# Altium schematic sheet Button.SchDoc
size A4; SheetNumber: 8; SheetTotal: 8
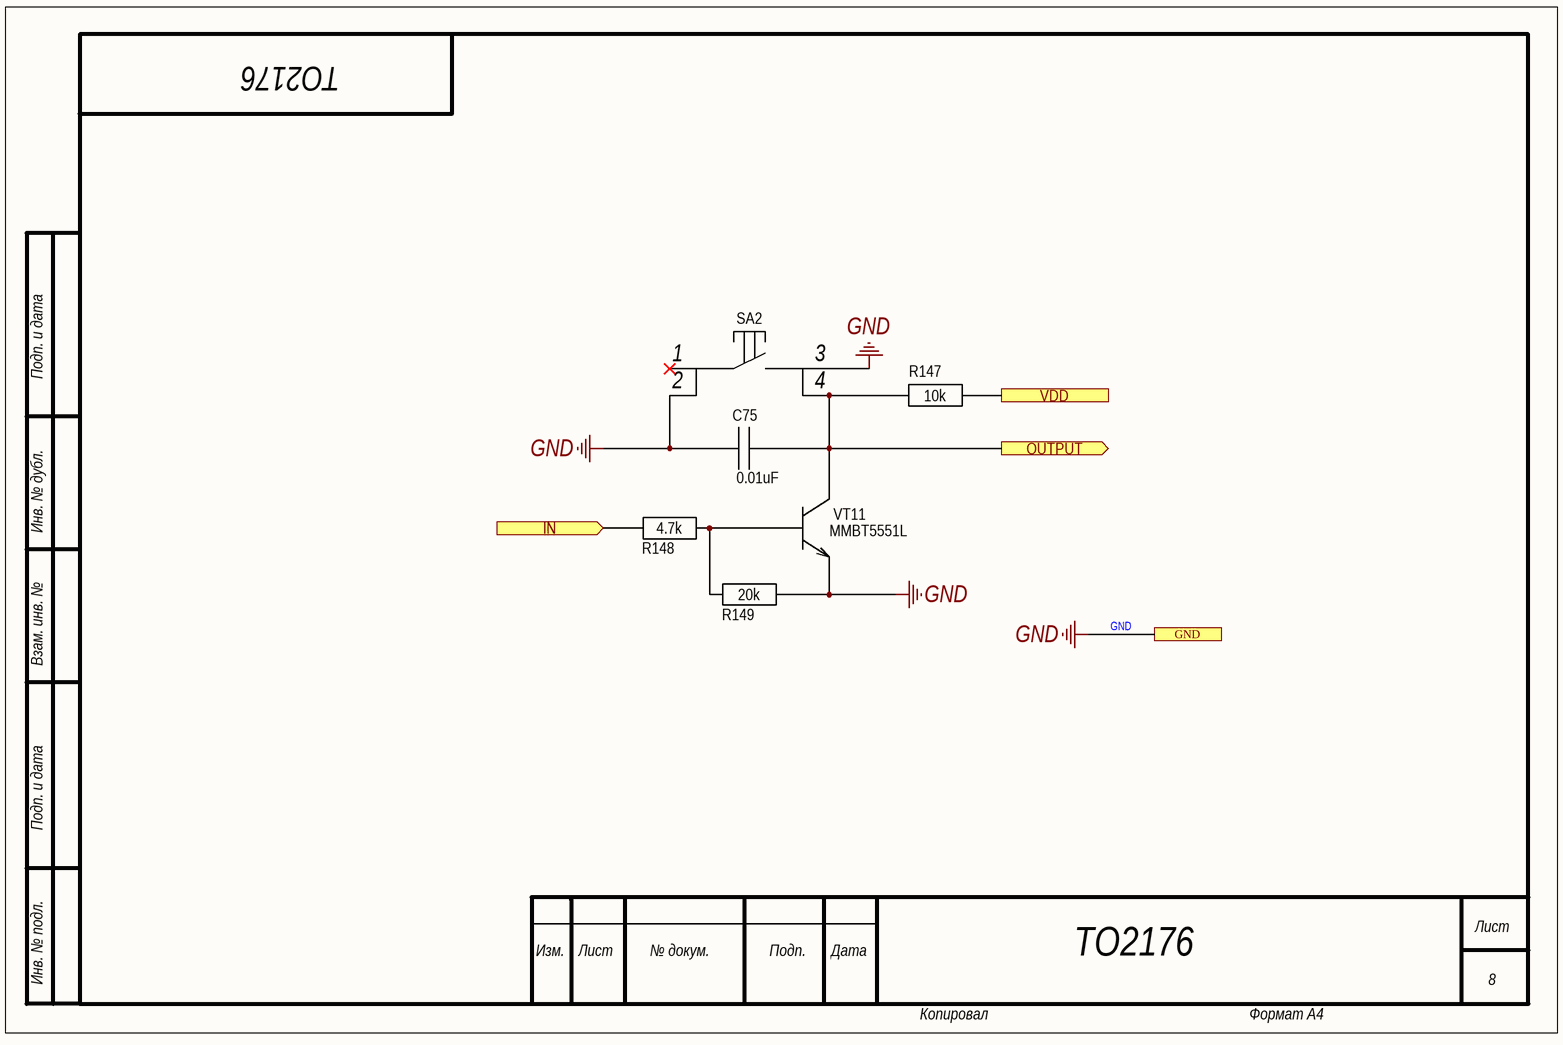
[diagram p0: Button.SchDoc]

## Parts
C75  0.01uF  [0805]
R147  10k  [0805]
R148  4.7k  [0805]
R149  20k  [0805]
SA2  KLS7-TS3401  [KLS7-TS3401]  (value not drawn)
VT11  MMBT5551L  [SOT-23]

## Ports
GND, IN (in), OUTPUT (out), VDD

## Nets
GND: C75.1 R149.1 SA2.2 SA2.3 VT11.2(E) ; port GND
IN: R148.2 ; port IN
OUTPUT: C75.2 R147.2 SA2.4 VT11.3(K) ; port OUTPUT
VDD: R147.1 ; port VDD
NetR148_1: R148.1 R149.2 VT11.1(B)

Not connected (* = marked no-connect by the designer): SA2 1*

## Notes on the sheet
- ТО2176
- Подп. и дата
- Инв. № дубл.
- Взам. инв. №
- Инв. № подл.
- Изм.
- Лист
- № докум.
- Подп.
- Дата
- 8
- Копировал
- Формат А4
- Перв. примен.
- Справ. №
- Разраб.
- Литера
- Масса
- Масштаб
- Пров.
- Т.контр.
- Листов
- Н.контр.
- Утв.
- Форма 1 ГОСТ 2.104-2006

## Library data of the parts
C75 = C0805: ComponentHeigt: 1.3; Firme: AVX; Leadform: SMD; KIND: Конденсатор; ClassName: *; Component Link: *; ComponentWeigt: *; Packaging: 0805; NN: *; Value: *
R147-R149 = R0805 Yageo: ComponentHeigt: 0.6; Firme: Yageo; Leadform: SMD; Kind: Резистор; ClassName: *; ComponentWeigt: *; Component Link: *; Packaging: 0805; NN: *; Value: *
SA2 = KLS7-TS3401: Component Heigt: 7; Leadform: SMD; Firme: TYCO; NN: 25100175; KIND: Кнопка 1-1977223-9 Tyco; ClassName: *; Component Link: *
VT11 = MMBT5551L: ComponentHeigt: 1.1; Firme: ONS; Leadform: SMD; NN: 24007468; KIND: Транзистор MMBT5551L*G ONS; ClassName: *; ComponentWeigt: *; Packaging: SOT-23